# Altium schematic sheet Ethernet-PoE-Sheet.SchDoc (part 1 of 3)
size 420 x 297 mm; SheetNumber: 8; SheetTotal: 9
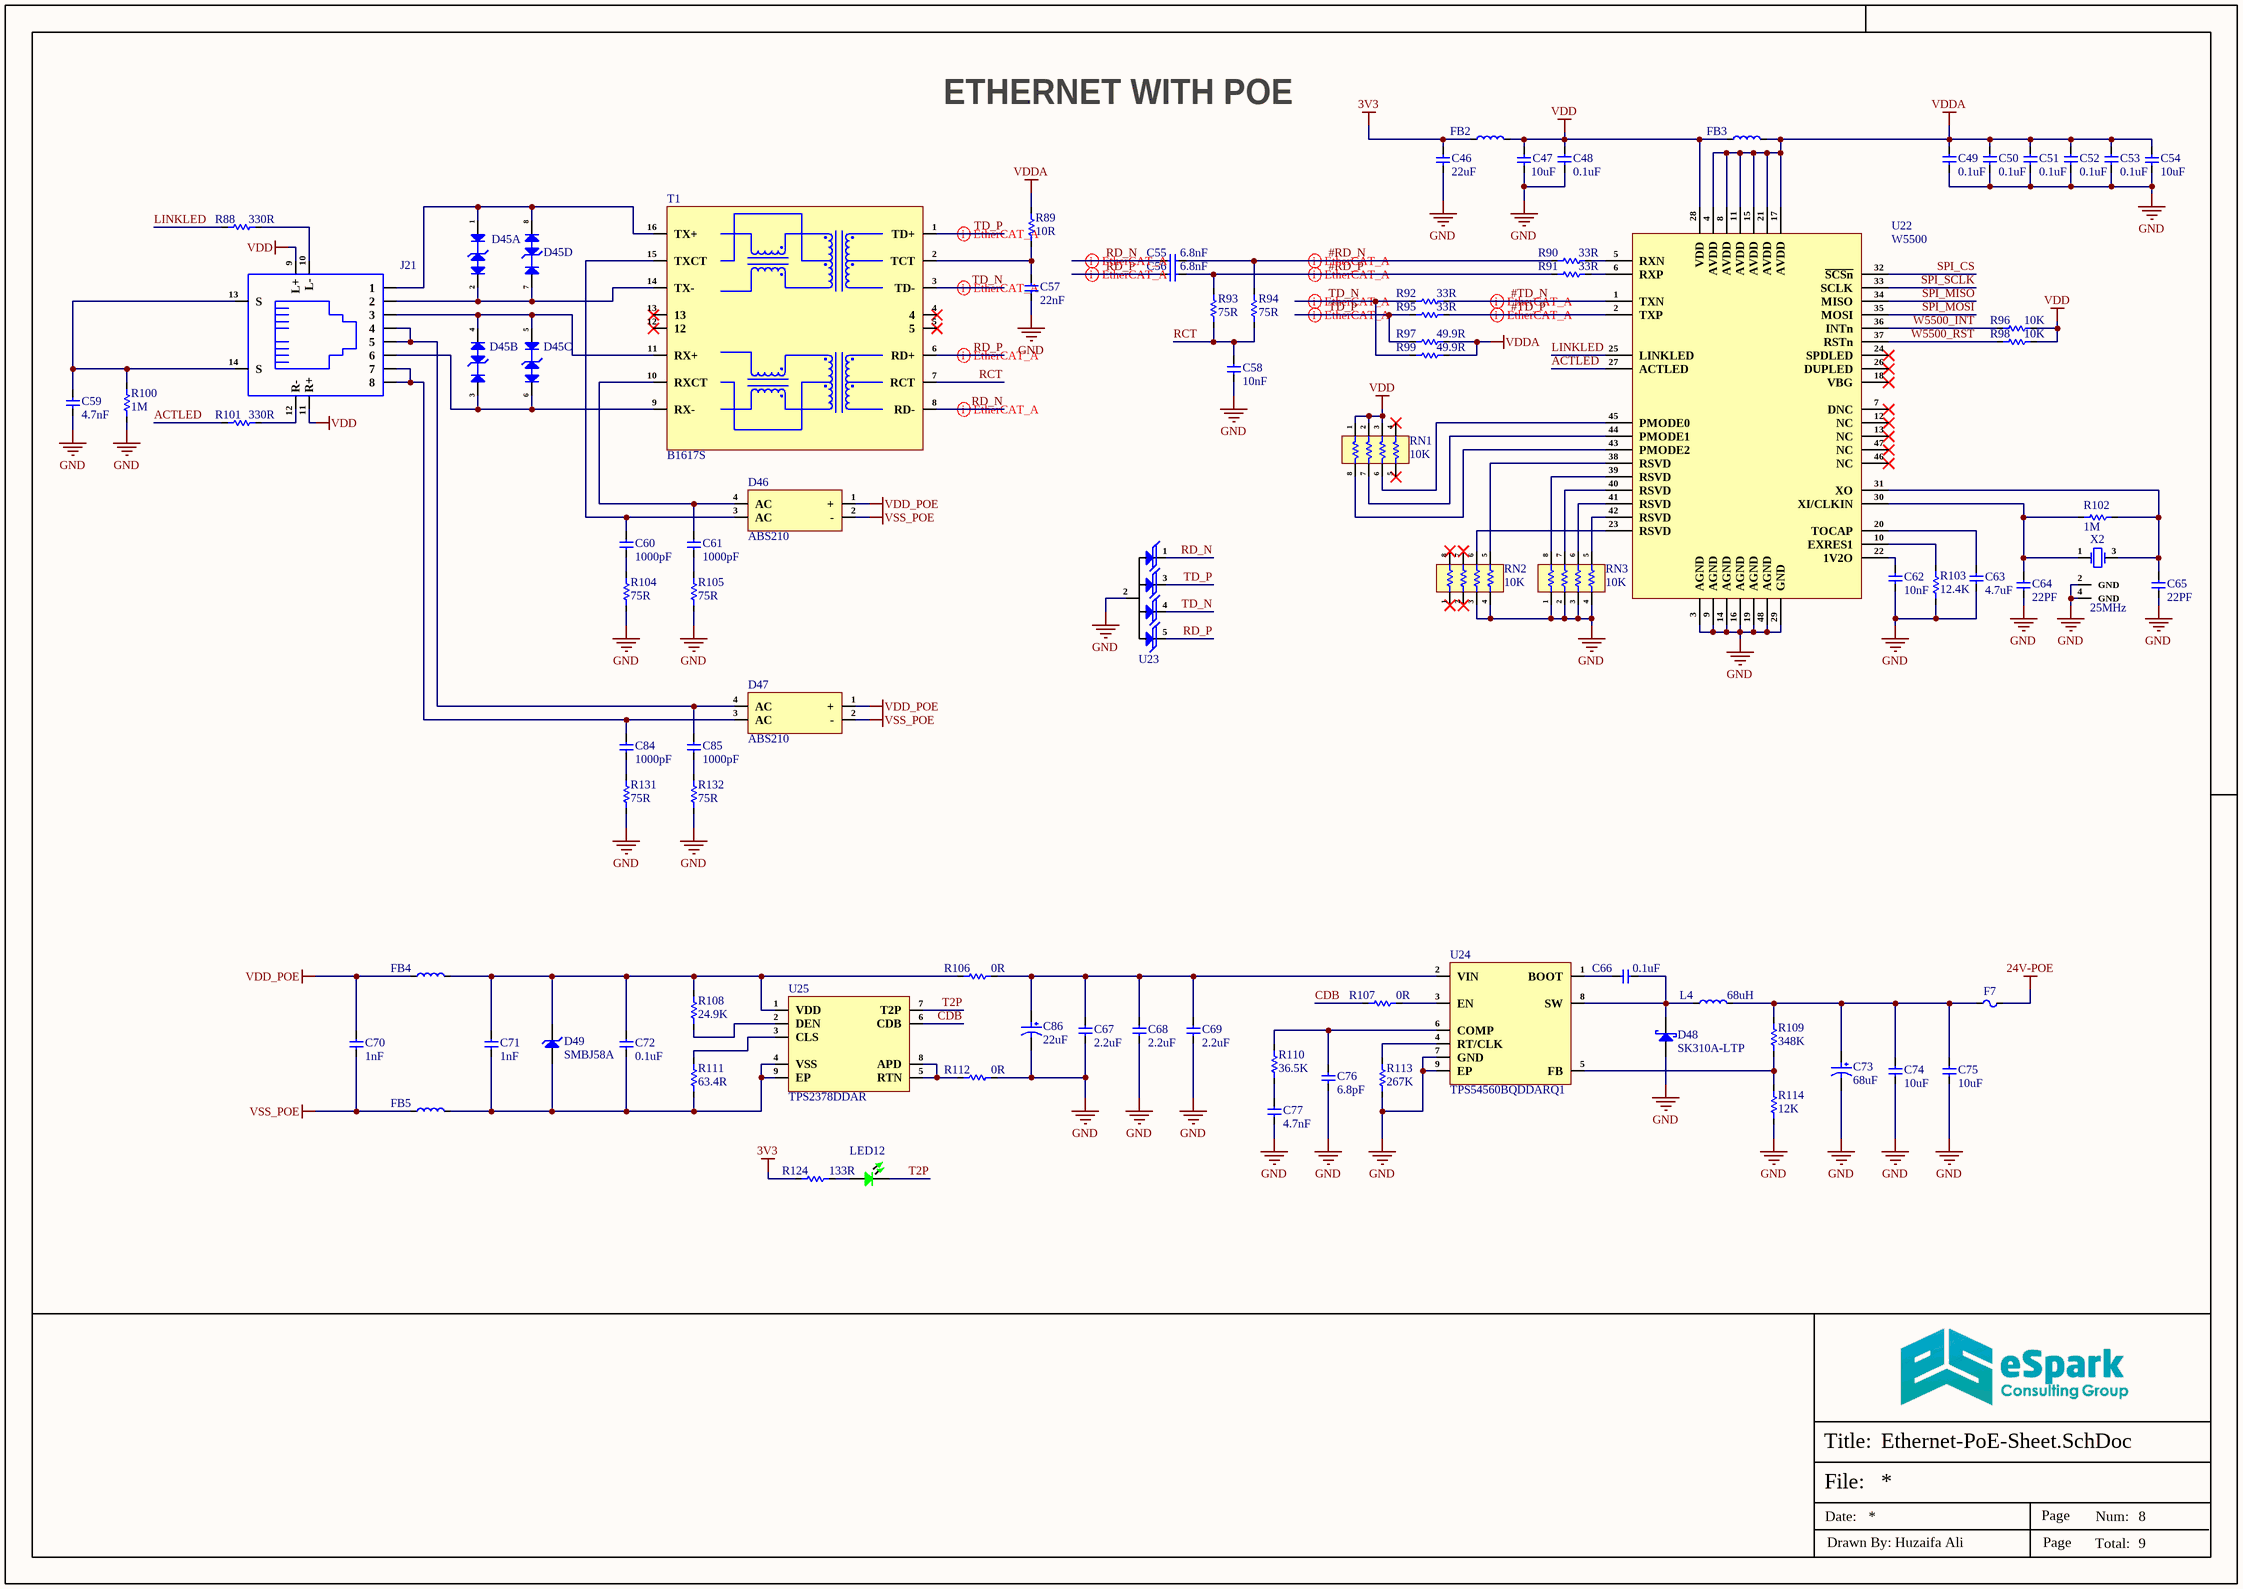
[diagram p0: Ethernet-PoE-Sheet.SchDoc]

## Parts
C46  22uF  [Cap-0805]
C47  10uF  [Cap-0603]
C48  0.1uF  [Cap-0402]
C49  0.1uF  [Cap-0402]
C50  0.1uF  [Cap-0402]
C51  0.1uF  [Cap-0402]
C52  0.1uF  [Cap-0402]
C53  0.1uF  [Cap-0402]
C54  10uF  [Cap-0603]
C55  6.8nF  [Cap-0603]
C56  6.8nF  [Cap-0603]
C57  22nF  [Cap-0603]
C58  10nF  [Cap-0603]
C59  4.7nF  [Cap-1206]
C60  1000pF  [Cap-1206]
C61  1000pF  [Cap-1206]
C62  10nF  [Cap-0603]
C63  4.7uF  [Cap-0603]
C64  22PF  [Cap-0402]
C65  22PF  [Cap-0402]
C66  0.1uF  [Cap-0603]
C67  2.2uF  [Cap-0805]
C68  2.2uF  [Cap-0805]
C69  2.2uF  [Cap-0805]
C70  1nF  [Cap-0603]
C71  1nF  [Cap-0603]
C72  0.1uF  [Cap-0603]
C73  68uF  [RVT1H680M0607]
C74  10uF  [Cap-1210]
C75  10uF  [Cap-1210]
C76  6.8pF  [Cap-0402]
C77  4.7nF  [Cap-0402]
C84  1000pF  [Cap-1206]
C85  1000pF  [Cap-1206]
C86  22uF  [EEEFK1J220P]
D45  SLVU2.8-4BTG  [SOIC-8(0.154", 3.90mm Width)]  (value not drawn)  (parts A,B,C,D of 4)
D46  ABS210  [ABS]
D47  ABS210  [ABS]
D48  SK310A-LTP  [SMA(DO-214AC)]
D49  SMBJ58A  [SMB_]
F7  1210L075/24PR  [FUSE-1210]  (value not drawn)
FB2  CBM201209U601T  [Ind-0805]  (value not drawn)
FB3  CBM201209U601T  [Ind-0805]  (value not drawn)
FB4  MPZ1608S221ATD25  [IND-0603 (1608 Metric)]  (value not drawn)
FB5  MPZ1608S221ATD25  [IND-0603 (1608 Metric)]  (value not drawn)
J21  R-RJ45R08P-C000  [R-RJ45R08P-C000]  (value not drawn)
L4  68uH  [FCH1365-680M]
LED12  Emerald  [LED-0603]  (value not drawn)
R88  330R  [Res-0603]
R89  10R  [Res-0603]
R90  33R  [Res-0603]
R91  33R  [Res-0603]
R92  33R  [Res-0603]
R93  75R  [Res-0603]
R94  75R  [Res-0603]
R95  33R  [Res-0603]
R96  10K  [Res-0402]
R97  49.9R  [Res-0603]
R98  10K  [Res-0402]
R99  49.9R  [Res-0603]
R100  1M  [Res-0603]
R101  330R  [Res-0603]
R102  1M  [Res-0402]
R103  12.4K  [Res-0603]
R104  75R  [Res-0603]
R105  75R  [Res-0603]
R106  0R  [Res-0805]
R107  0R  [Res-0402]
R108  24.9K  [Res-0603]
R109  348K  [RES-0805]
R110  36.5K  [Res-0603]
R111  63.4R  [Res-0603]
R112  0R  [Res-0805]
R113  267K  [Res-0603]
R114  12K  [Res-0603]
R124  133R  [Res-0402]
R131  75R  [Res-0603]
R132  75R  [Res-0603]
RN1  10K  [YC164-FR-0710KL]
RN2  10K  [YC164-FR-0710KL]
RN3  10K  [YC164-FR-0710KL]
T1  B1617S  [B1617S]
U22  W5500  [48-LQFP (7x7)_]
U23  SP0504BAHTG  [SOT-23-5]  (value not drawn)
U24  TPS54560BQDDARQ1  [8-SO PowerPad]
U25  TPS2378DDAR  [8-SO PowerPad]
X2  25MHz  [SMD3225-4P]

## Nets
3V3: C46.2 FB2.1 R124.1
24V-POE: F7.2
GND: C46.1 C47.1 C48.2 C49.2 C50.2 C51.2 C52.2 C53.2 C54.1 C57.1 C58.1 C59.1 C62.1 C63.1 C64.1 C65.1 C67.1 C68.1 C69.1 C73.2 C74.1 C75.1 C76.1 C77.1 C86.2 D48.2(A) R100.1 R103.1 R104.1 R105.1 R112.2 R113.1 R114.1 R131.1 R132.1 RN2.3 RN2.4 RN3.1 RN3.2 RN3.3 RN3.4 U22.3(AGND) U22.9(AGND) U22.14(AGND) U22.16(AGND) U22.19(AGND) U22.29(GND) U22.48(AGND) U23.2(A) U24.7(GND) U24.9(EP) X2.2(GND) X2.4(GND)
VDD: C47.2 C48.1 FB2.2 FB3.1 J21.9(L+) J21.11(R+) R96.1 R98.1 RN1.1 RN1.2 RN1.3 U22.28(VDD)
VDD_POE: C70.2 D46.1(+) D47.1(+) FB4.1
VDDA: C49.1 C50.1 C51.1 C52.1 C53.1 C54.2 FB3.2 R89.2 R97.2 R99.2 U22.4(AVDD) U22.8(AVDD) U22.11(AVDD) U22.15(AVDD) U22.17(AVDD) U22.21(AVDD)
VSS_POE: C70.1 D46.2(-) D47.2(-) FB5.1
#RD_N: C55.2 R90.1 R94.2
#RD_P: C56.2 R91.1 R93.2
#TD_N: R92.2 U22.1(TXN)
#TD_P: R95.2 U22.2(TXP)
ACTLED: R101.1 U22.27(ACTLED)
CDB: R107.1 U25.6(CDB)
LINKLED: R88.1 U22.25(LINKLED)
RCT: C58.2 R93.1 R94.1 T1.7(RCT)
RD_N: C55.1 T1.8(RD-) U23.1(K)
RD_P: C56.1 T1.6(RD+) U23.5(K)
SPI_CS: U22.32(~{SCSn})
SPI_MISO: U22.34(MISO)
SPI_MOSI: U22.35(MOSI)
SPI_SCLK: U22.33(SCLK)
T2P: LED12.2 U25.7(T2P)
TD_N: R92.1 R99.1 T1.3(TD-) U23.4(K)
TD_P: R95.1 R97.1 T1.1(TD+) U23.3(K)
W5500_INT: R96.2 U22.36(INTn)
W5500_RST: R98.2 U22.37(RSTn)
NetC57_2: C57.2 R89.1 T1.2(TCT)
NetC59_2: C59.2 J21.13(S) J21.14(S) R100.2
NetC60_1: C60.1 R104.2
NetC60_2: C60.2 D46.3(AC) T1.15(TXCT)
NetC61_1: C61.1 R105.2
NetC61_2: C61.2 D46.4(AC) T1.10(RXCT)
NetC62_2: C62.2 U22.22(1V2O)
NetC63_2: C63.2 U22.20(TOCAP)
NetC64_2: C64.2 R102.1 U22.30(XI/CLKIN) X2.1(CRYSTAL)
NetC65_2: C65.2 R102.2 U22.31(XO) X2.3(CRYSTAL)
NetC66_1: C66.1 D48.1(K) L4.1 U24.8(SW)
NetC66_2: C66.2 U24.1(BOOT)
NetC67_2: C67.2 C68.2 C69.2 C86.1 R106.2 U24.2(VIN)
NetC71_1: C71.1 C72.1 D49.1(A) FB5.2 R111.1 U25.4(VSS) U25.9(EP)
NetC71_2: C71.2 C72.2 D49.2(K) FB4.2 R106.1 R108.2 U25.1(VDD)
NetC73_1: C73.1 C74.2 C75.2 F7.1 L4.2 R109.2
NetC76_2: C76.2 R110.2 U24.6(COMP)
NetC77_2: C77.2 R110.1
NetC84_1: C84.1 R131.2
NetC84_2: C84.2 D47.3(AC) J21.7 J21.8
NetC85_1: C85.1 R132.2
NetC85_2: C85.2 D47.4(AC) J21.4 J21.5
NetD45_1: D45.1(A) D45.8(K) J21.1 T1.16(TX+)
NetD45_2: D45.2(K) D45.7(A) J21.2 T1.14(TX-)
NetD45_3: D45.3(A) D45.6(K) J21.6 T1.9(RX-)
NetD45_4: D45.4(K) D45.5(A) J21.3 T1.11(RX+)
NetJ21_10: J21.10(L-) R88.2
NetJ21_12: J21.12(R-) R101.2
NetLED12_1: LED12.1 R124.2
NetR90_2: R90.2 U22.5(RXN)
NetR91_2: R91.2 U22.6(RXP)
NetR103_2: R103.2 U22.10(EXRES1)
NetR107_2: R107.2 U24.3(EN)
NetR108_1: R108.1 U25.2(DEN)
NetR109_1: R109.1 R114.2 U24.5(FB)
NetR111_2: R111.2 U25.3(CLS)
NetR112_1: R112.1 U25.5(RTN) U25.8(APD)
NetR113_2: R113.2 U24.4(RT/CLK)
NetRN1_6: RN1.6 U22.45(PMODE0)
NetRN1_7: RN1.7 U22.44(PMODE1)
NetRN1_8: RN1.8 U22.43(PMODE2)
NetRN2_5: RN2.5 U22.38(RSVD)
NetRN2_6: RN2.6 U22.23(RSVD)
NetRN3_5: RN3.5 U22.42(RSVD)
NetRN3_6: RN3.6 U22.41(RSVD)
NetRN3_7: RN3.7 U22.40(RSVD)
NetRN3_8: RN3.8 U22.39(RSVD)

Not connected (* = marked no-connect by the designer): RN1 4* 5*; RN2 1* 2* 7* 8*; T1 4* 5* 12* 13*; U22 7(DNC)* 12(NC)* 13(NC)* 18(VBG)* 24(SPDLED)* 26(DUPLED)* 46(NC)* 47(NC)*

## Layout directives
differential pair; differential pair class Ethernet_Lines; net class Ethernet; rule Matched Net Lengths [Tolerance = 20mil]; rule Impedance Constraint [Min = 97.00    Max = 105.0    ]: #RD_N, #RD_P, #TD_N, #TD_P, RD_N, RD_P, TD_N, TD_P

## Notes on the sheet
- ETHERNET WITH POE
- File:
- Title:
- Date:
- Page
- Num:
- Total:
- Drawn By: Huzaifa Ali